# Altium schematic sheet LDO.SchDoc
size A4; SheetNumber: 2; SheetTotal: 2
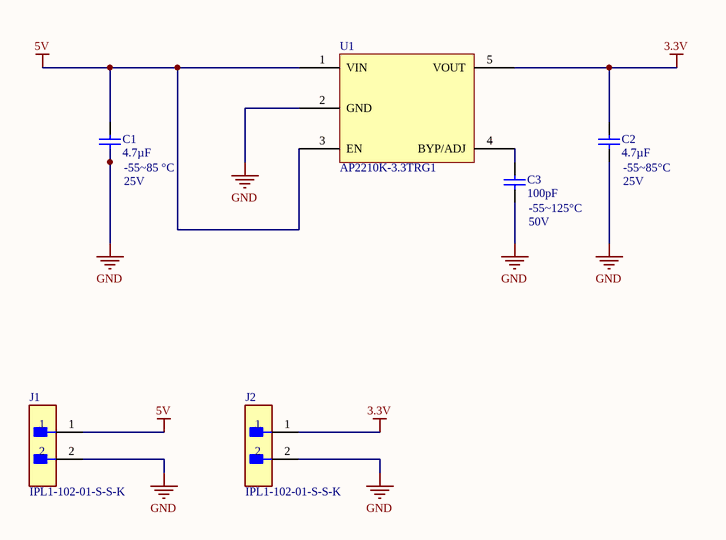
[diagram p0: LDO.SchDoc]

## Parts
C1  value 4.7µF  TEMP: -55~85 °C  CPAR: 25V  [CAP0402]  (hidden comment: Capacitor)
C2  value 4.7µF  TEMP: -55~85°C  CPAR: 25V  [CAP0402]  (hidden comment: Capacitor)
C3  value 100pF  TEMP: -55~125°C  CPAR: 50V  [CAP0402]  (hidden comment: Capacitor)
J1  IPL1-102-01-S-S-K  [FP-IPL1-102-01-S-S-K-0]
J2  IPL1-102-01-S-S-K  [FP-IPL1-102-01-S-S-K-0]
U1  AP2210K-3.3TRG1  [AP2210  300mA RF ULDO REGULATOR]

## Nets
3.3V: C2.1 J2.1 U1.5(VOUT)
5V: C1.1 J1.1 U1.1(VIN) U1.3(EN)
GND: C1.2 C2.2 C3.2 J1.2 J2.2 U1.2(GND)
NetC3_1: C3.1 U1.4(BYP/ADJ)

## Library data of the parts
C1 C2 = Capacitor: GRM188R61E475KE11D; SimulationGenericComponent: True
C3 = Capacitor: GRM1555C1H101JA01D; SimulationGenericComponent: True
J1 J2 = CMP-02766-000483-1: 2 Position 1 Row .100" (2.54 mm) pitch connector; Number of Terminals/Pins: 2; Number of Ports: 1; Gender: Male; Pitch: 2.54mm; Max Current Rating: 7.4A; Connector Type: Male Pin; Max Voltage Rating (AC): 675V; Contact Plating: Gold; Contact Material: Bronze; Color: Natural; Min Operating Temperature: -55°C; Number of Positions: 2; Number of Rows: 1; Max Operating Temperature: 125°C; Length: 6.6mm; Radiation Hardening: No; Package Quantity: 1; Fastening Type: Ramp; Termination: Solder; Number of Contacts: 2; Orientation: Straight; Contact Mating Length: 0.215inch; Housing Material: Polymer; Packaging: Rail/Tube; Mount: Through Hole
U1 = AP2210K-3.3TRG1: IC REG LINEAR 3.3V 300MA SOT23-5; Manufacturer 1: Diodes Incorporated; Manufacturer Part Number 1: AP2210K-3.3TRG1; Supplier 1: DigiKey; Supplier Part Number 1: AP2210K-3.3TRG1DITR-ND